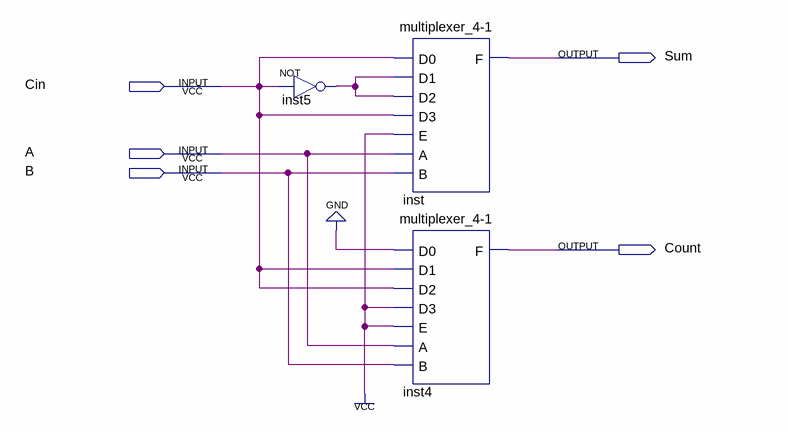
[diagram p0: schematic sheet]
// Quartus schematic SUM_on_MUX4to1.bdf as structural Verilog: 3 symbols, 5 pins
module SUM_on_MUX4to1 (
  input  Cin,
  input  A,
  input  B,
  output Sum,
  output Count
);

  wire inst5_out;

  not inst5 (inst5_out, Cin);
  \multiplexer_4-1  inst (.D0(Cin), .D1(inst5_out), .D2(inst5_out), .D3(Cin), .E(1'b1), .A(A), .B(B), .F(Sum));
  \multiplexer_4-1  inst4 (.D0(1'b0), .D1(Cin), .D2(Cin), .D3(1'b1), .E(1'b1), .A(A), .B(B), .F(Count));
endmodule
